# Altium schematic sheet 02.Power_Uint.SchDoc: 02.Power_Uint
size A4; Organization: Altium Limited; Address1: L3, 12a Rodborough Rd; Address2: Frenchs Forest; Address3: NSW; Address4: Australia 2086; SheetNumber: 2; SheetTotal: 4
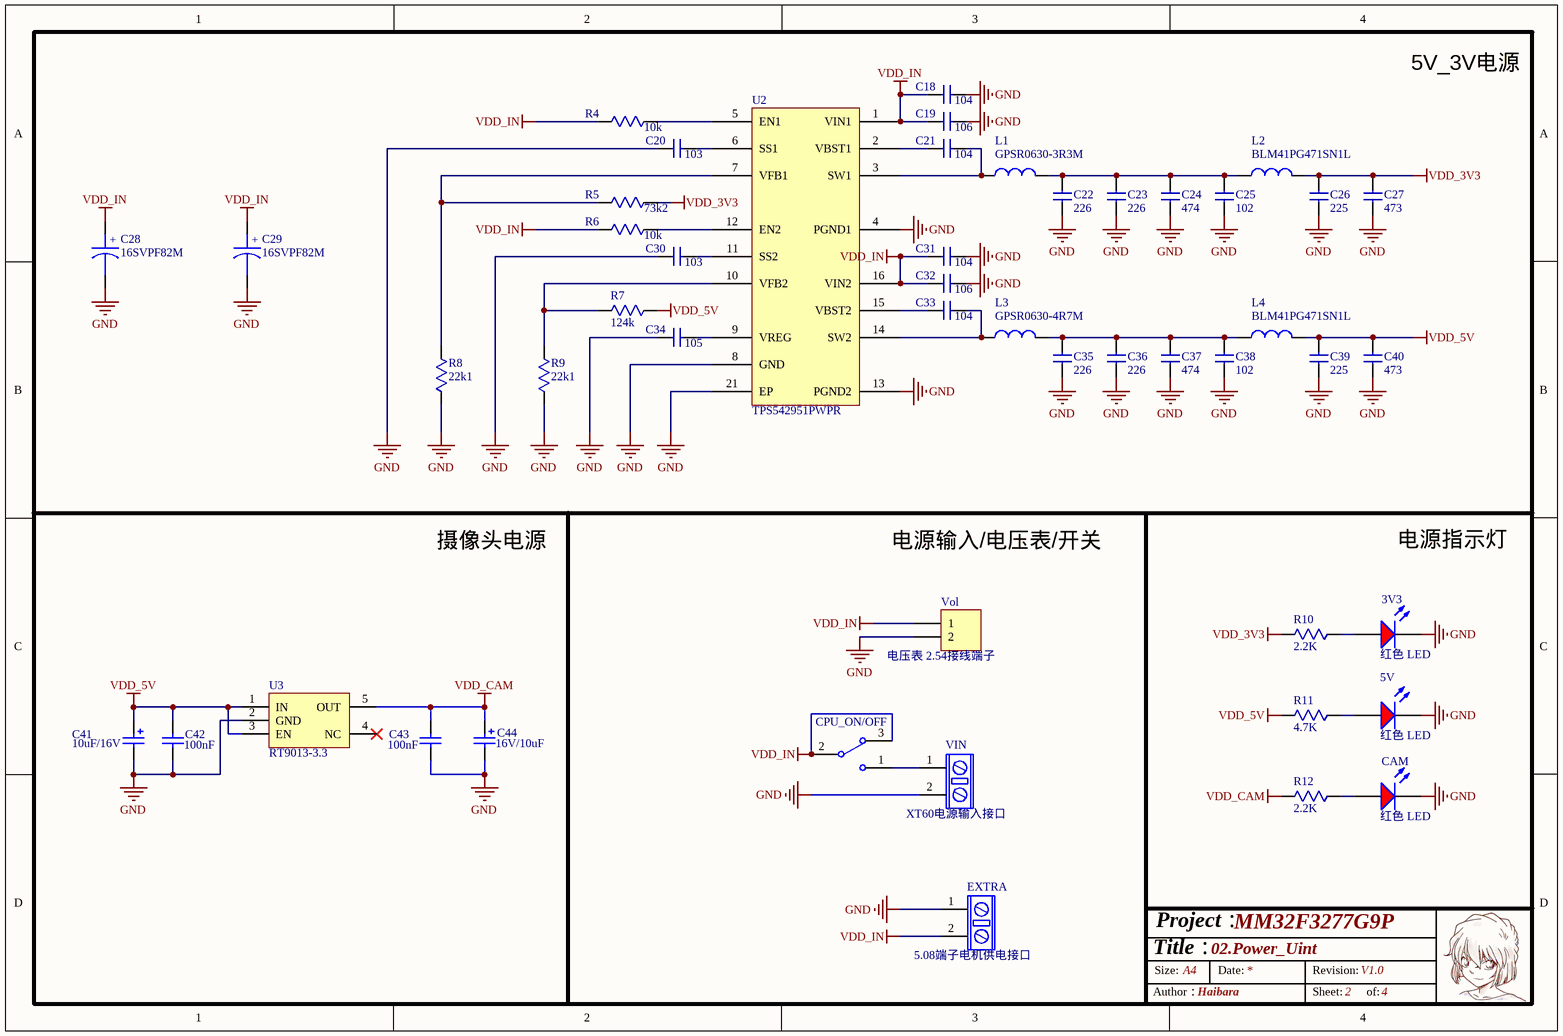
[diagram p0: 02.Power_Uint.SchDoc]

## Parts
3V3  红色 LED  [0603 LED R]
5V  红色 LED  [0603 LED R]
C18  104  [C0603]
C19  106  [C0805]
C20  103  [C0603]
C21  104  [C0805]
C22  226  [C0805]
C23  226  [C0805]
C24  474  [C0603]
C25  102  [C0603]
C26  225  [C0603]
C27  473  [C0603]
C28  16SVPF82M  [CAP 2.5*6.3*11.2]
C29  16SVPF82M  [CAP 2.5*6.3*11.2]
C30  103  [C0603]
C31  104  [C0603]
C32  106  [C0805]
C33  104  [C0805]
C34  105  [C0603]
C35  226  [C0805]
C36  226  [C0805]
C37  474  [C0603]
C38  102  [C0603]
C39  225  [C0603]
C40  473  [C0603]
C41  10UF  [C0805]  (value not drawn)
C42  100nF  [0603 电容 C3]
C43  100nF  [0603 电容 C3]
C44  value 16V/10uF  [C0805]  (hidden comment: 10UF)
CAM  红色 LED  [0603 LED R]
CPU_ON/OFF  SW-SPDT  [MTS-102S 两档纽子开关]  (value not drawn)
EXTRA  5.08端子电机供电接口  [5.08 螺钉式 2p]
L1  GPSR0630-3R3M  [L 0630]
L2  BLM41PG471SN1L  [R1206]
L3  GPSR0630-4R7M  [L 0630]
L4  BLM41PG471SN1L  [R1206]
R4  10k  [R0603]
R5  73k2  [R0603]
R6  10k  [R0603]
R7  124k  [R0603]
R8  22k1  [R0603]
R9  22k1  [R0603]
R10  2.2K  [R0603]
R11  4.7K  [R0603]
R12  2.2K  [R0603]
U2  TPS542951PWPR  [SSOP16_EP]
U3  RT9013-3.3  [SOT23-5N]
VIN  XT60电源输入接口  [XT60 母头 电源接口]
Vol  电压表 2.54接线端子  [XH2.54-LI-2P]

## Nets
GND: 3V3.2 5V.2 C18.2 C19.2 C20.1 C22.1 C23.1 C24.1 C25.1 C26.1 C27.1 C28.2 C29.2 C30.1 C31.2 C32.2 C34.1 C35.1 C36.1 C37.1 C38.1 C39.1 C40.1 C41.2 C42.1 C43.1 C44.2 CAM.2 EXTRA.1 R8.1 R9.1 U2.4(PGND1) U2.8(GND) U2.13(PGND2) U2.21(EP) U3.2(GND) VIN.2 Vol.2
VDD_3V3: C26.2 C27.2 L2.2 R5.1 R10.1
VDD_5V: C39.2 C40.2 C41.1 C42.2 L4.2 R7.1 R11.1 U3.1(IN) U3.3(EN)
VDD_CAM: C43.2 C44.1 R12.1 U3.5(OUT)
VDD_IN: C18.1 C19.1 C28.1 C29.1 C31.1 C32.1 CPU_ON/OFF.2 CPU_ON/OFF.3 EXTRA.2 R4.2 R6.2 U2.1(VIN1) U2.16(VIN2) Vol.1
Net3V3_1: 3V3.1 R10.2
Net5V_1: 5V.1 R11.2
NetC20_2: C20.2 U2.6(SS1)
NetC21_1: C21.1 U2.2(VBST1)
NetC21_2: C21.2 L1.1 U2.3(SW1)
NetC22_2: C22.2 C23.2 C24.2 C25.2 L1.2 L2.1
NetC30_2: C30.2 U2.11(SS2)
NetC33_1: C33.1 U2.15(VBST2)
NetC33_2: C33.2 L3.1 U2.14(SW2)
NetC34_2: C34.2 U2.9(VREG)
NetC35_2: C35.2 C36.2 C37.2 C38.2 L3.2 L4.1
NetCAM_1: CAM.1 R12.2
NetCPU_ON/OFF_1: CPU_ON/OFF.1 VIN.1
NetR4_1: R4.1 U2.5(EN1)
NetR5_2: R5.2 R8.2 U2.7(VFB1)
NetR6_1: R6.1 U2.12(EN2)
NetR7_2: R7.2 R9.2 U2.10(VFB2)

Not connected (* = marked no-connect by the designer): U3 4(NC)*

## Notes on the sheet
- Labels drawn without touching a wire or pin: 5V_3V电源, 摄像头电源, 电源指示灯, 电源输入/电压表/开关
- Title：
- Size:
- Project：
- A4
- Date:
- MM32F3277G9P
- Revision:
- V1.0
- Author：
- Haibara
- Sheet:
- of:
- (in symbol CAP POL) +
- (in symbol Cap Pol2) 10uF/16V

## Library data of the parts
3V3 5V CAM = 红灯: 发光二极管; ComponentLink1Description: 供应商链接; ComponentLink1URL: http://www.szlcsc.com/product/details_2668.html; Package: 0805; Supplier: LC; SuppliersPartNumber: C2295
C18-C27 C30-C40 = 电容
C28 C29 = CAP POL: Capacitor
C41 C44 = Cap Pol2: Polarized Capacitor (Axial); Published: 8-Jun-2000; LatestRevisionDate: 17-Jul-2002; LatestRevisionNote: Re-released for DXP Platform.; PackageReference: POLAR0.8; Publisher: Altium Limited; PackageDescription: Polarized Capacitor; 2 Leads
C42 C43 = Cap: Capacitor; Published: 8-Jun-2000; LatestRevisionDate: 17-Jul-2002; LatestRevisionNote: Re-released for DXP Platform.; PackageReference: RAD-0.3; Publisher: Altium Limited; PackageDescription: Radial Cap, Thru-Hole; 2 Leads; 0.3 in Pin Spacing
CPU_ON/OFF = SW-SPDT: SPDT Subminiature Toggle Switch, Right Angle Mounting, Vertical Actuation; Published: 24-Mar-1999; LatestRevisionDate: 17-Dec-2003; LatestRevisionNote: Schematic revised, PCB Footprint replaced.; DatasheetVersion: 05-Dec-2000; PackageReference: TL36WW15050; Publisher: Altium Limited; PackageDescription: Switch; 4 Leads; ComponentLink1Description: Manufacturer Link; ComponentLink1URL: http://www.apem.com
EXTRA VIN = 电机供电接口
L1 L3 = 电感
L2 L4 = 磁珠: BLM18PG471SN1D
R4-R12 = 电阻
U3 = RT9013-3.3: 3.3V电源芯片
Vol = Header 2: Header, 2-Pin; LatestRevisionDate: 17-Jul-2002; LatestRevisionNote: Re-released for DXP Platform.; Publisher: Altium Limited